# Altium schematic sheet Nodo_rack.SchDoc: Ambiental Monitoring | Rack-node
size A; Date: 13/10/2026; Author: Sebastian Hernandez & Diego Lopez; DocumentNumber: 1; Revision: 1.2; SheetNumber: 1; SheetTotal: 3
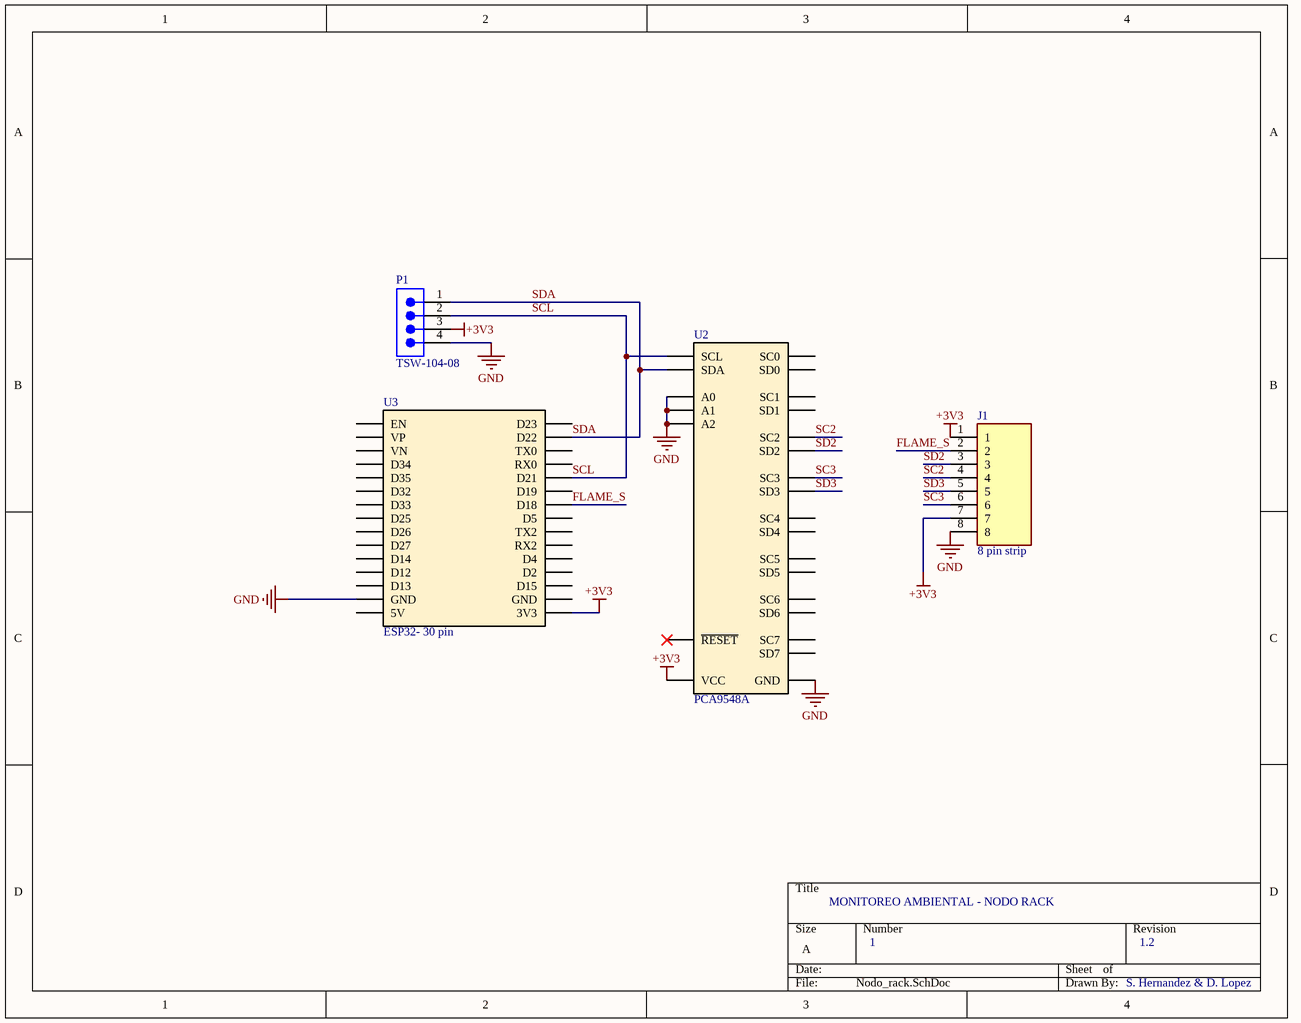
[diagram p0: Nodo_rack.SchDoc]

## Parts
J1  8 pin strip  [8 Pin_2.54mm]
P1  TSW-104-08  [SMTC-TSW-104-08-X-S]
U2  PCA9548A  [PCA9548A]
U3  ESP32- 30 pin  [ESP32 - 30 pin]

## Nets
+3V3: J1.1 J1.7 P1.3 U2.24(VCC) U3.16(3V3)
GND: J1.8 P1.4 U2.1(A0) U2.2(A1) U2.12(GND) U2.21(A2) U3.2(GND)
FLAME_S: J1.2 U3.24(D18)
SC2: J1.4 U2.9(SC2)
SC3: J1.6 U2.11(SC3)
SCL: P1.2 U2.22(SCL) U3.26(D21)
SD2: J1.3 U2.8(SD2)
SD3: J1.5 U2.10(SD3)
SDA: P1.1 U2.23(SDA) U3.29(D22)

Not connected (* = marked no-connect by the designer): U2 3(~{RESET})* 4(SD0) 5(SC0) 6(SD1) 7(SC1) 13(SD4) 14(SC4) 15(SD5) 16(SC5) 17(SD6) 18(SC6) 19(SD7) 20(SC7); U3 1(5V) 3(D13) 4(D12) 5(D14) 6(D27) 7(D26) 8(D25) 9(D33) 10(D32) 11(D35) 12(D34) 13(VN) 14(VP) 15(EN) 17(GND) 18(D15) 19(D2) 20(D4) 21(RX2) 22(TX2) 23(D5) 25(D19) 27(RX0) 28(TX0) 30(D23)

## Notes on the sheet
- MONITOREO AMBIENTAL - NODO RACK
- 1
- 1.2
- S. Hernandez & D. Lopez

## Library data of the parts
P1 = CMP-1024-00358-1: 0.025" SQ Post Header, Through-hole, Vertical, -55 to 125 degC, 2.54 mm Pitch, 4-Pin, Male, RoHS; PartNumber: TSW-104-08-L-S; Manufacturer: Samtec; Pitch: 2.54 mm; RoHS: True; Temperature Range: -55 to 125 degC; PackageDescription: .025[0.64] SQ. Post Terminal Strip Assembly; Orientation: Vertical; ComponentLink2URL: http://www.samtec.com/documents/webfiles/pdf/TSW_TH.PDF; ComponentLink1Description: Manufacturer URL; ComponentLink2Description: Datasheet; PackageVersion: DM, 8/1988; ComponentLink3URL: http://www.samtec.com/documents/webfiles/cpdf/TSW-XXX-XX-XXX-X-XX-XXX-MKT.pdf; Mounting Technology: Through-hole; PackageReference: TSW-104-08-X-S; ComponentLink3Description: Package Specification; ComponentLink1URL: http://www.samtec.com; DatasheetVersion: F-214